# Altium schematic sheet POWER_SHEET.SchDoc
size A; SheetNumber: 7; SheetTotal: 9
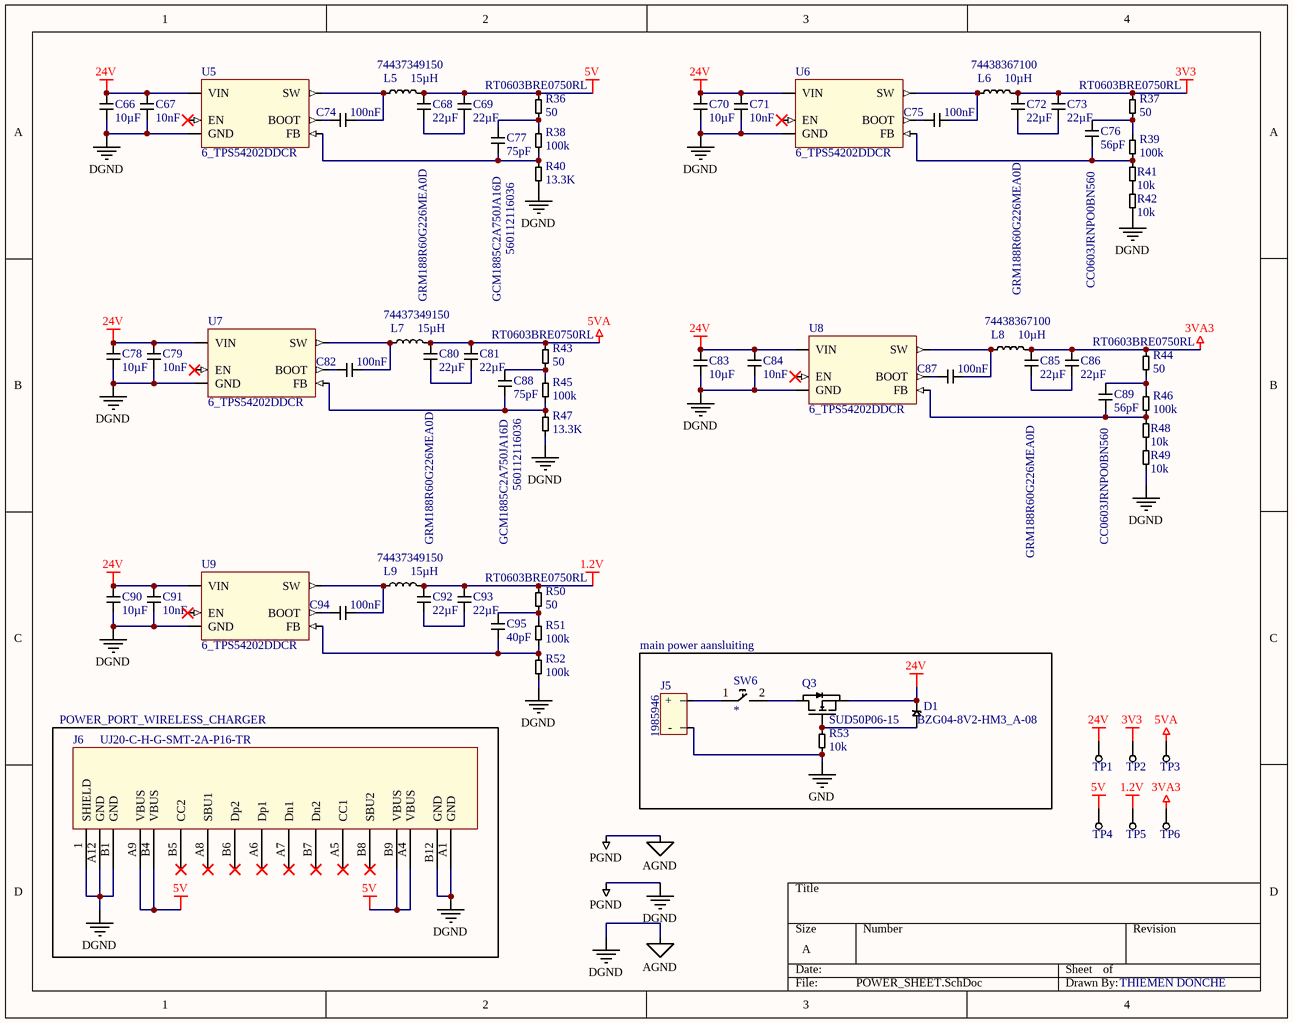
[diagram p0: POWER_SHEET.SchDoc]

## Parts
C66  10µF  [0603_SMD_CAP]
C67  10nF  [0603_SMD_CAP]
C68  22µF  type: GRM188R60G226MEA0D  [0603_SMD_CAP]
C69  22µF  [0603_SMD_CAP]
C70  10µF  [0603_SMD_CAP]
C71  10nF  [0603_SMD_CAP]
C72  22µF  type: GRM188R60G226MEA0D  [0603_SMD_CAP]
C73  22µF  [0603_SMD_CAP]
C74  100nF  [0603_SMD_CAP]
C75  100nF  [0603_SMD_CAP]
C76  56pF  type: CC0603JRNPO0BN560  [0603_SMD_CAP]
C77  75pF  type: GCM1885C2A750JA16D  [0603_SMD_CAP]
C78  10µF  [0603_SMD_CAP]
C79  10nF  [0603_SMD_CAP]
C80  22µF  type: GRM188R60G226MEA0D  [0603_SMD_CAP]
C81  22µF  [0603_SMD_CAP]
C82  100nF  [0603_SMD_CAP]
C83  10µF  [0603_SMD_CAP]
C84  10nF  [0603_SMD_CAP]
C85  22µF  type: GRM188R60G226MEA0D  [0603_SMD_CAP]
C86  22µF  [0603_SMD_CAP]
C87  100nF  [0603_SMD_CAP]
C88  75pF  type: GCM1885C2A750JA16D  [0603_SMD_CAP]
C89  56pF  type: CC0603JRNPO0BN560  [0603_SMD_CAP]
C90  10µF  [0603_SMD_CAP]
C91  10nF  [0603_SMD_CAP]
C92  22µF  [0603_SMD_CAP]
C93  22µF  [0603_SMD_CAP]
C94  100nF  [0603_SMD_CAP]
C95  40pF  [0603_SMD_CAP]
D1  type: BZG04-8V2-HM3_A-08  [DO-214AA]  (hidden comment: zener diode)
J5  type: 1985946  [2_FIXED-TERMINAL]  (hidden comment: 2P_connector)
J6  type: UJ20-C-H-G-SMT-2A-P16-TR  [12 pin USB connector]  (hidden comment: 12pin_USB-CONNECTOR)
L5  15µH  type: 74437349150  [7050_SMD_INDUCTOR]
L6  10µH  type: 74438367100  [5030_SMD_INDUCTOR]
L7  15µH  type: 74437349150  [7050_SMD_INDUCTOR]
L8  10µH  type: 74438367100  [5030_SMD_INDUCTOR]
L9  15µH  type: 74437349150  [7050_SMD_INDUCTOR]
Q3  type: SUD50P06-15  [TO-252 FOOTPINT]  (hidden comment: P-channel verijkingsmosfet)
R36  50  type: RT0603BRE0750RL  [0603_SMD_PACKAGE]
R37  50  type: RT0603BRE0750RL  [0603_SMD_PACKAGE]
R38  100k  [0603_SMD_PACKAGE]
R39  100k  [0603_SMD_PACKAGE]
R40  13.3K  type: 560112116036  [0603_SMD_PACKAGE]
R41  10k  [0201_SMD_FOOTPRINT]
R42  10k  [0201_SMD_FOOTPRINT]
R43  50  type: RT0603BRE0750RL  [0603_SMD_PACKAGE]
R44  50  type: RT0603BRE0750RL  [0603_SMD_PACKAGE]
R45  100k  [0603_SMD_PACKAGE]
R46  100k  [0603_SMD_PACKAGE]
R47  13.3K  type: 560112116036  [0603_SMD_PACKAGE]
R48  10k  [0201_SMD_FOOTPRINT]
R49  10k  [0201_SMD_FOOTPRINT]
R50  50  type: RT0603BRE0750RL  [0603_SMD_PACKAGE]
R51  100k  [0603_SMD_PACKAGE]
R52  100k  [0603_SMD_PACKAGE]
R53  10k  [0201_SMD_FOOTPRINT]
SW6  2-PIN_SWITCH  (value not drawn)
TP1  Test_punt  [round pad]  (value not drawn)
TP2  Test_punt  [round pad]  (value not drawn)
TP3  Test_punt  [round pad]  (value not drawn)
TP4  Test_punt  [round pad]  (value not drawn)
TP5  Test_punt  [round pad]  (value not drawn)
TP6  Test_punt  [round pad]  (value not drawn)
U5  6_TPS54202DDCR  [SOT23-6_TPS54202DDCR]
U6  6_TPS54202DDCR  [SOT23-6_TPS54202DDCR]
U7  6_TPS54202DDCR  [SOT23-6_TPS54202DDCR]
U8  6_TPS54202DDCR  [SOT23-6_TPS54202DDCR]
U9  6_TPS54202DDCR  [SOT23-6_TPS54202DDCR]

## Blocks framed on the sheet
main power aansluiting: D1 J5 Q3 R53 SW6
POWER_PORT_WIRELESS_CHARGER: J6

## Nets
1.2V: C92.2 C93.2 L9.2 R50.2 TP5.1
3V3: C72.2 C73.2 L6.2 R37.2 TP2.1
3VA3: C85.2 C86.2 L8.2 R44.2 TP6.1
5V: C68.2 C69.2 J6.A4(VBUS) J6.A9(VBUS) J6.B4(VBUS) J6.B9(VBUS) L5.2 R36.2 TP4.1
5VA: C80.2 C81.2 L7.2 R43.2 TP3.1
24V: C66.2 C67.2 C70.2 C71.2 C78.2 C79.2 C83.2 C84.2 C90.2 C91.2 D1.2 Q3.2(S) TP1.1 U5.3(VIN) U6.3(VIN) U7.3(VIN) U8.3(VIN) U9.3(VIN)
AGND: C66.1 C67.1 C70.1 C71.1 C78.1 C79.1 C83.1 C84.1 C90.1 C91.1 J6.1(SHIELD) J6.A1(GND) J6.A12(GND) J6.B1(GND) J6.B12(GND) R40.1 R42.1 R47.1 R49.1 R52.1 U5.1(GND) U6.1(GND) U7.1(GND) U8.1(GND) U9.1(GND)  [also labelled DGND, PGND]
GND: J5.2(-) R53.1
NetC68_1: C68.1 C69.1
NetC72_1: C72.1 C73.1
NetC74_1: C74.1 L5.1 U5.2(SW)
NetC74_2: C74.2 U5.6(BOOT)
NetC75_1: C75.1 L6.1 U6.2(SW)
NetC75_2: C75.2 U6.6(BOOT)
NetC76_1: C76.1 R39.1 R41.2 U6.4(FB)
NetC76_2: C76.2 R37.1 R39.2
NetC77_1: C77.1 R38.1 R40.2 U5.4(FB)
NetC77_2: C77.2 R36.1 R38.2
NetC80_1: C80.1 C81.1
NetC82_1: C82.1 L7.1 U7.2(SW)
NetC82_2: C82.2 U7.6(BOOT)
NetC85_1: C85.1 C86.1
NetC87_1: C87.1 L8.1 U8.2(SW)
NetC87_2: C87.2 U8.6(BOOT)
NetC88_1: C88.1 R45.1 R47.2 U7.4(FB)
NetC88_2: C88.2 R43.1 R45.2
NetC89_1: C89.1 R46.1 R48.2 U8.4(FB)
NetC89_2: C89.2 R44.1 R46.2
NetC92_1: C92.1 C93.1
NetC94_1: C94.1 L9.1 U9.2(SW)
NetC94_2: C94.2 U9.6(BOOT)
NetC95_1: C95.1 R51.1 R52.2 U9.4(FB)
NetC95_2: C95.2 R50.1 R51.2
NetD1_1: D1.1 Q3.1(G) R53.2
NetJ5_1: J5.1(+) SW6.1
NetQ3_3: Q3.3(D) SW6.2
NetR41_1: R41.1 R42.2
NetR48_1: R48.1 R49.2

Not connected (* = marked no-connect by the designer): J6 A5(CC1)* A6(Dp1)* A7(Dn1)* A8(SBU1)* B5(CC2)* B6(Dp2)* B7(Dn2)* B8(SBU2)*; U5 5(EN)*; U6 5(EN)*; U7 5(EN)*; U8 5(EN)*; U9 5(EN)*

## Notes on the sheet
- THIEMEN DONCHE

## Library data of the parts
C66-C91 C93 C94 = ceramic capacator
  C66 C67 C69-C71 C73-C75 C78 C79 C81-C84 C86 C87 C90 C91 C93 C94: type: *
C92 = ceramic capacator: type: GRM188R60G226MEA0D
C95 = ceramic capacator: type: GCM1885C2A750JA16D
J6 = 12pin_USB-CONNECTOR: pin to pad: A1>A1/B12 A4>A4/B9 A9>B4/A9 A12>B1/A12 B1>B1/A12 B4>B4/A9 B9>A4/B9 B12>A1/B12
L5-L9 = inductor
R36-R53 = resistor
  R38 R39 R41 R42 R45 R46 R48 R49 R51 R53: type: *
  R52: type: 560112116036
U5-U9 = 6_TPS54202DDCR: SMPS BUCK, Vin: 4.5V-28V, Vout: 0V-28V, 1output, Iout 2A; Supplier 1: Mouser; Supplier Part Number 1: 595-TPS54202DDCR
SW6 = 2-PIN_SWITCH: type: *